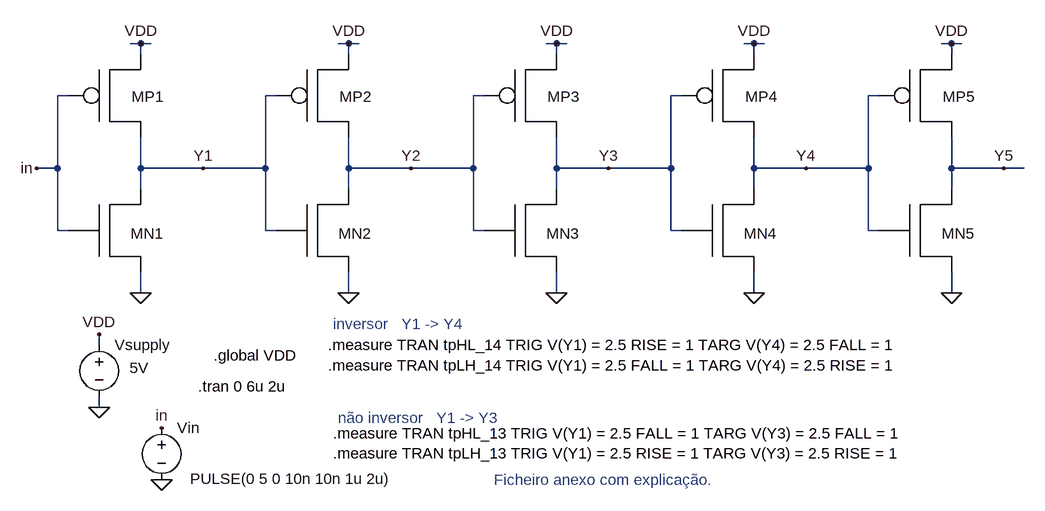
[diagram p0: schematic meas-delay.asc]
meas-delay.asc, the LTspice schematic file:
Version 4.1
SHEET 1 2672 1244
WIRE 384 -128 368 -128
WIRE 400 -128 384 -128
WIRE 704 -128 688 -128
WIRE 720 -128 704 -128
WIRE 1024 -128 1008 -128
WIRE 1040 -128 1024 -128
WIRE 1328 -128 1312 -128
WIRE 1344 -128 1328 -128
WIRE 1632 -128 1616 -128
WIRE 1648 -128 1632 -128
WIRE 384 -112 384 -128
WIRE 704 -112 704 -128
WIRE 1024 -112 1024 -128
WIRE 1328 -112 1328 -128
WIRE 1632 -112 1632 -128
WIRE 272 -48 256 -48
WIRE 592 -48 576 -48
WIRE 912 -48 896 -48
WIRE 1216 -48 1200 -48
WIRE 1520 -48 1504 -48
WIRE 256 64 256 -48
WIRE 256 64 224 64
WIRE 384 64 384 16
WIRE 480 64 384 64
WIRE 576 64 576 -48
WIRE 576 64 480 64
WIRE 704 64 704 16
WIRE 800 64 704 64
WIRE 896 64 896 -48
WIRE 896 64 800 64
WIRE 1024 64 1024 16
WIRE 1104 64 1024 64
WIRE 1200 64 1200 -48
WIRE 1200 64 1104 64
WIRE 1328 64 1328 16
WIRE 1408 64 1328 64
WIRE 1504 64 1504 -48
WIRE 1504 64 1408 64
WIRE 1632 64 1632 16
WIRE 1712 64 1632 64
WIRE 1744 64 1712 64
WIRE 384 96 384 64
WIRE 704 96 704 64
WIRE 1024 96 1024 64
WIRE 1328 96 1328 64
WIRE 1632 96 1632 64
WIRE 256 160 256 64
WIRE 272 160 256 160
WIRE 576 160 576 64
WIRE 592 160 576 160
WIRE 896 160 896 64
WIRE 912 160 896 160
WIRE 1200 160 1200 64
WIRE 1216 160 1200 160
WIRE 1504 160 1504 64
WIRE 1520 160 1504 160
WIRE 384 256 384 224
WIRE 704 256 704 224
WIRE 1024 256 1024 224
WIRE 1328 256 1328 224
WIRE 1632 256 1632 224
WIRE 320 336 320 320
WIRE 320 432 320 416
FLAG 320 432 0
FLAG 416 544 0
FLAG 320 320 VDD
FLAG 416 464 in
FLAG 384 -128 VDD
FLAG 384 256 0
FLAG 224 64 in
FLAG 704 -128 VDD
FLAG 704 256 0
FLAG 1024 -128 VDD
FLAG 1024 256 0
FLAG 480 64 Y1
FLAG 800 64 Y2
FLAG 1104 64 Y3
FLAG 1328 -128 VDD
FLAG 1328 256 0
FLAG 1408 64 Y4
FLAG 1632 -128 VDD
FLAG 1632 256 0
FLAG 1712 64 Y5
SYMBOL voltage 320 320 R0
WINDOW 3 47 51 Left 2
SYMATTR Value 5V
SYMATTR InstName Vsupply
SYMBOL voltage 416 448 R0
WINDOW 123 0 0 Left 2
WINDOW 39 0 0 Left 2
WINDOW 3 44 94 Left 2
SYMATTR Value PULSE(0 5 0 10n 10n 1u 2u)
SYMATTR InstName Vin
SYMBOL PMOSX 352 -64 R0
SYMATTR InstName MP1
SYMBOL NMOSX 352 144 R0
SYMATTR InstName MN1
SYMBOL PMOSX 672 -64 R0
SYMATTR InstName MP2
SYMBOL NMOSX 672 144 R0
SYMATTR InstName MN2
SYMBOL PMOSX 992 -64 R0
SYMATTR InstName MP3
SYMBOL NMOSX 992 144 R0
SYMATTR InstName MN3
SYMBOL PMOSX 1296 -64 R0
SYMATTR InstName MP4
SYMBOL NMOSX 1296 144 R0
SYMATTR InstName MN4
SYMBOL PMOSX 1600 -64 R0
SYMATTR InstName MP5
SYMBOL NMOSX 1600 144 R0
SYMATTR InstName MN5
TEXT 496 352 Left 2 !.global VDD
TEXT 472 400 Left 2 !.tran 0 6u 2u
TEXT 672 336 Left 2 !.measure TRAN tpHL_14 TRIG V(Y1) = 2.5 RISE = 1 TARG V(Y4) = 2.5 FALL = 1\n.measure TRAN tpLH_14 TRIG V(Y1) = 2.5 FALL = 1 TARG V(Y4) = 2.5 RISE = 1
TEXT 680 472 Left 2 !.measure TRAN tpHL_13 TRIG V(Y1) = 2.5 FALL = 1 TARG V(Y3) = 2.5 FALL = 1\n.measure TRAN tpLH_13 TRIG V(Y1) = 2.5 RISE = 1 TARG V(Y3) = 2.5 RISE = 1
TEXT 688 448 Left 2 ;não inversor   Y1 -> Y3
TEXT 680 304 Left 2 ;inversor   Y1 -> Y4
TEXT 928 544 Left 2 ;Ficheiro anexo com explicação.

The netlist it stands for:
* meas-delay.asc
Vsupply VDD 0 5V
Vin in 0 PULSE(0 5 0 10n 10n 1u 2u)
X§MP1 Y1 in VDD PMOSX  ; pins D G S
X§MN1 Y1 in 0 NMOSX  ; pins D G S
X§MP2 Y2 Y1 VDD PMOSX  ; pins D G S
X§MN2 Y2 Y1 0 NMOSX  ; pins D G S
X§MP3 Y3 Y2 VDD PMOSX  ; pins D G S
X§MN3 Y3 Y2 0 NMOSX  ; pins D G S
X§MP4 Y4 Y3 VDD PMOSX  ; pins D G S
X§MN4 Y4 Y3 0 NMOSX  ; pins D G S
X§MP5 Y5 Y4 VDD PMOSX  ; pins D G S
X§MN5 Y5 Y4 0 NMOSX  ; pins D G S
.global VDD
.tran 0 6u 2u
.measure TRAN tpHL_14 TRIG V(Y1) = 2.5 RISE = 1 TARG V(Y4) = 2.5 FALL = 1
.measure TRAN tpLH_14 TRIG V(Y1) = 2.5 FALL = 1 TARG V(Y4) = 2.5 RISE = 1
.measure TRAN tpHL_13 TRIG V(Y1) = 2.5 FALL = 1 TARG V(Y3) = 2.5 FALL = 1
.measure TRAN tpLH_13 TRIG V(Y1) = 2.5 RISE = 1 TARG V(Y3) = 2.5 RISE = 1
* não inversor   Y1 -> Y3
* inversor   Y1 -> Y4
* Ficheiro anexo com explicação.
.lib MOS4007.txt
.backanno
.end